# EasyEDA Pro project 1mmFPC_reading_board_source_v1.epro

# Schematic Schematic1
Assembly Variant: Basic; Board Name: Board1; Create Date: 2026-10-10; Page Name: P1; Project Name: rp_reading_board; Schematic Name: Schematic1; Update Date: 2026-10-10; Company: 嘉立创EDA; Page Size: A4; Version: V1.0
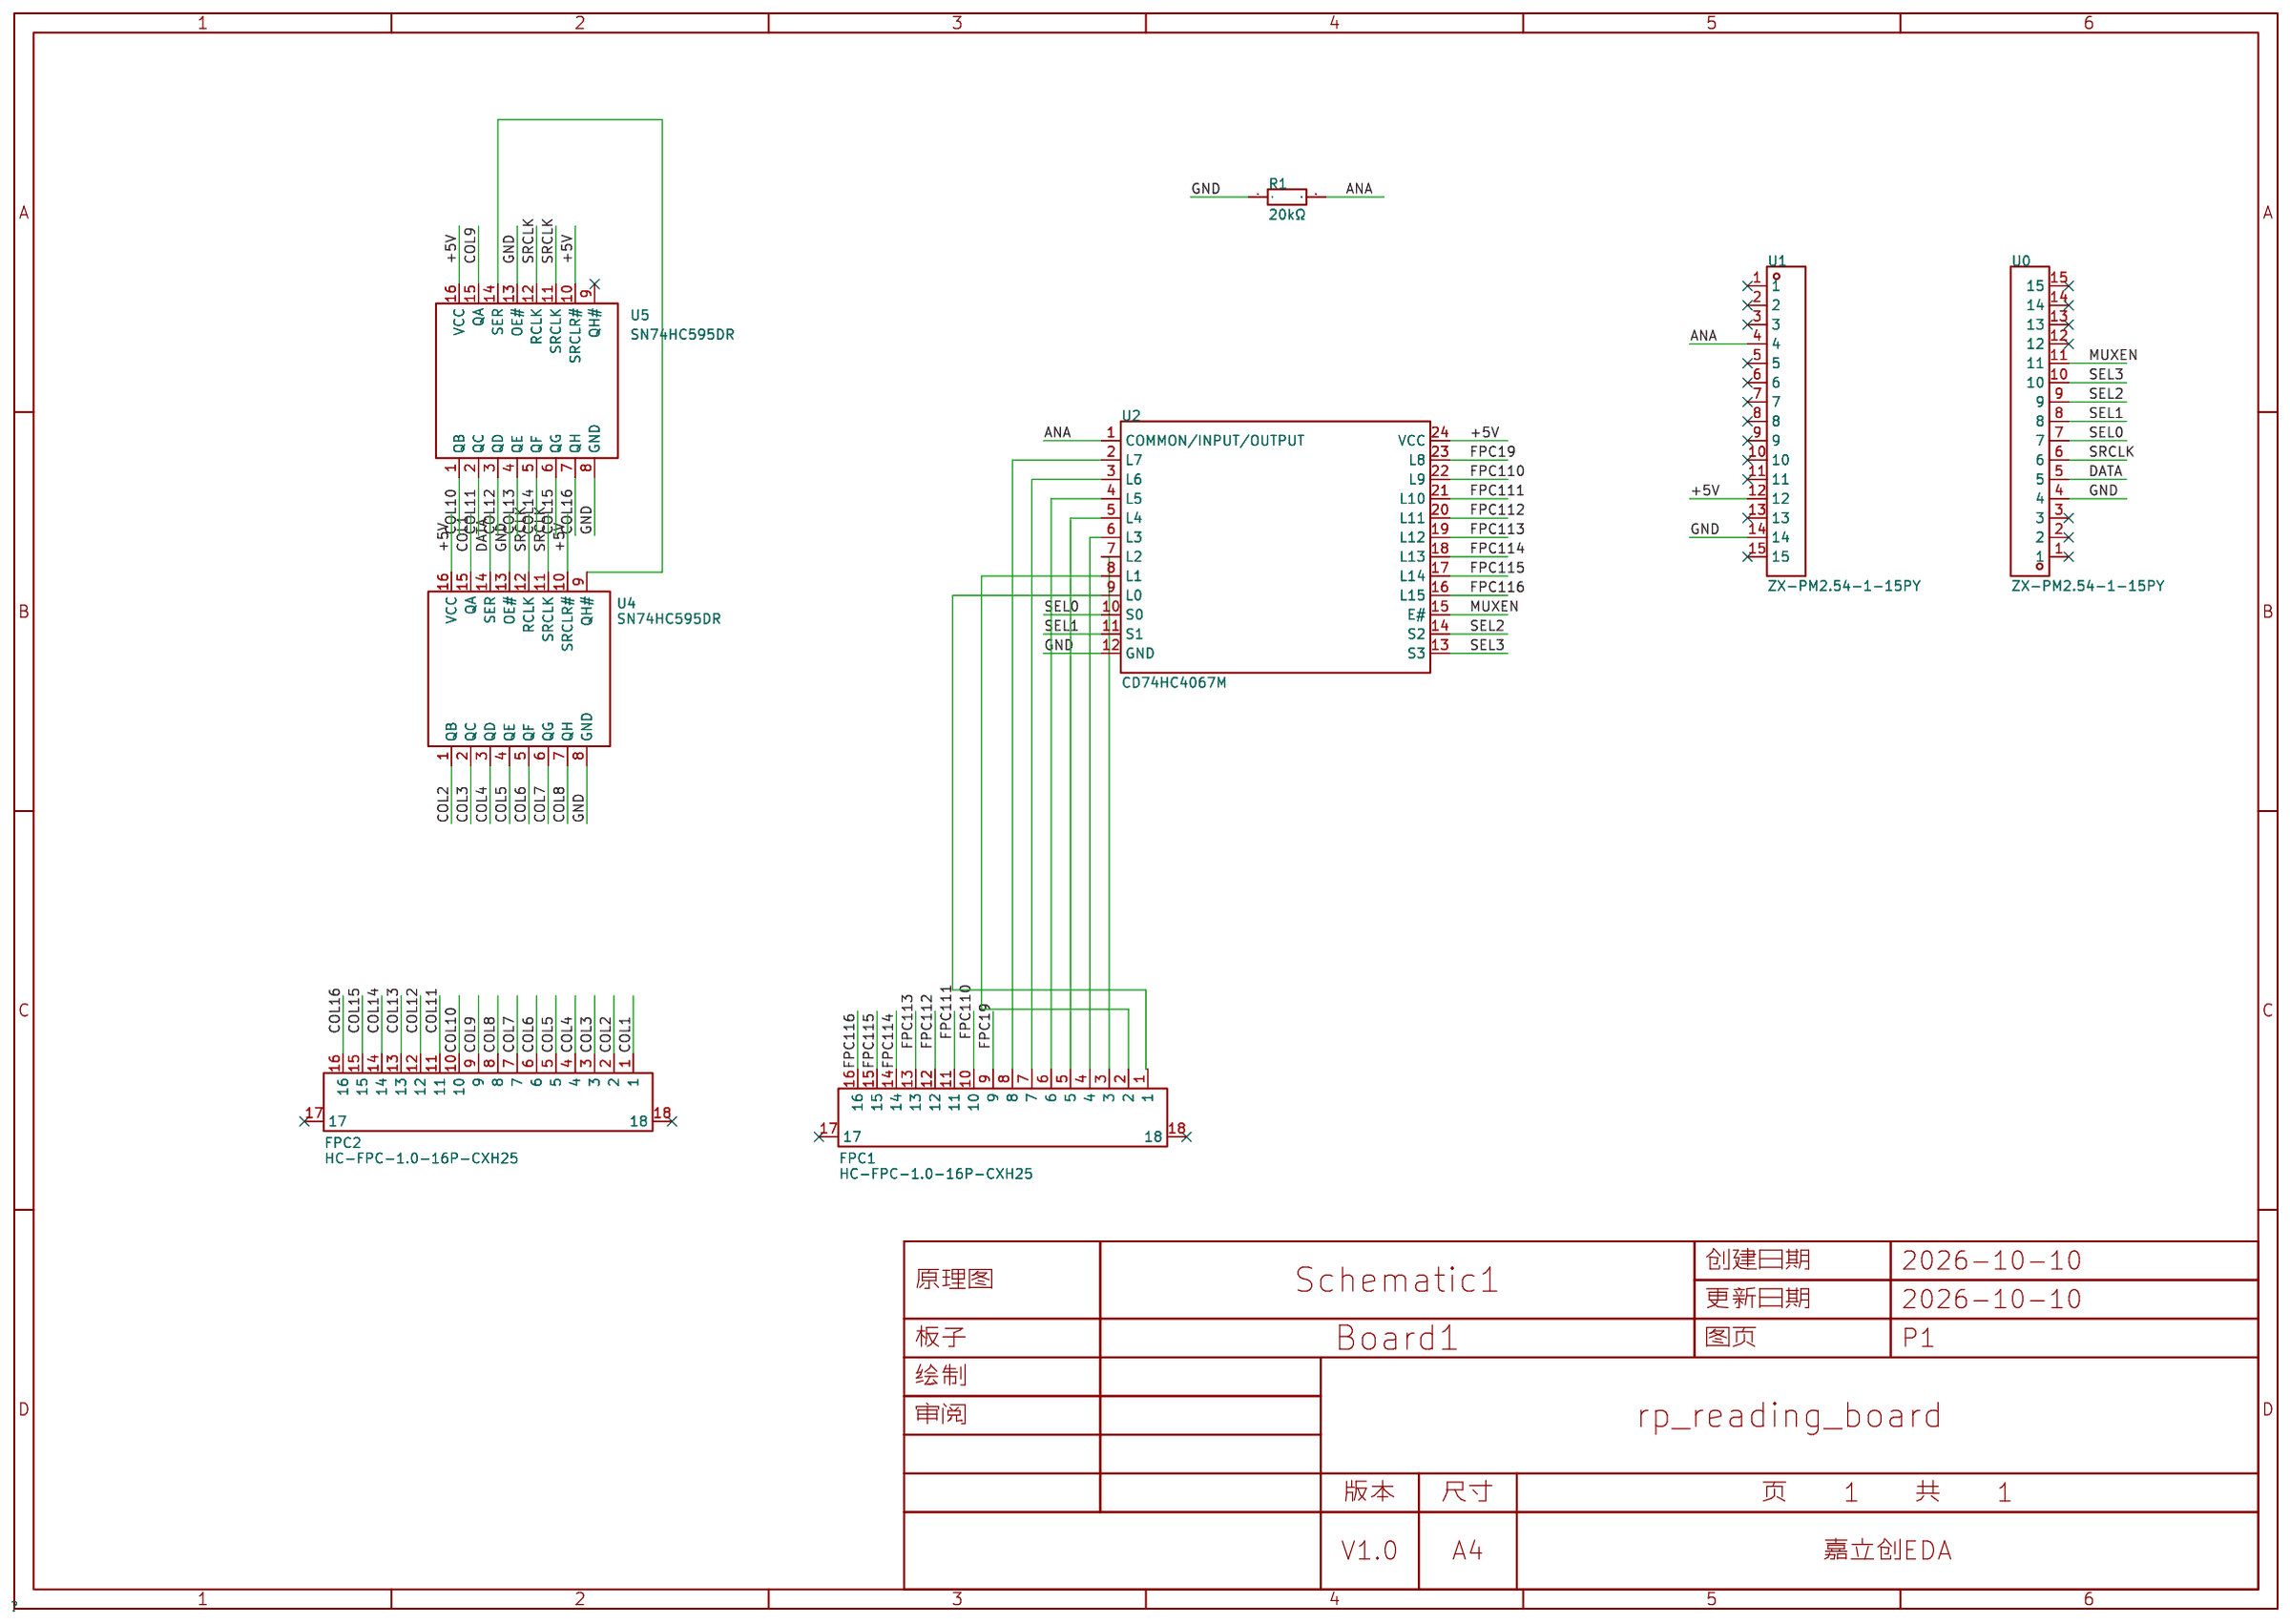
[diagram p0: schematic sheet]

## Parts
FPC1  HC-FPC-1.0-16P-CXH25  [FPC-SMD_16P-P1.00_HC-FPC-1.0-16P-CXH25]
FPC2  HC-FPC-1.0-16P-CXH25  [FPC-SMD_16P-P1.00_HC-FPC-1.0-16P-CXH25]
R1  20kΩ  [R0603]
U0  ZX-PM2.54-1-15PY  [HDR-TH_15P-P2.54-V-F]
U1  ZX-PM2.54-1-15PY  [HDR-TH_15P-P2.54-V-F]
U2  CD74HC4067M  [SOIC-24_L15.4-W7.5-P1.27-LS10.3-BL]
U4  SN74HC595DR  [SOIC-16_L9.9-W3.9-P1.27-LS6.0-BL]
U5  SN74HC595DR  [SOIC-16_L9.9-W3.9-P1.27-LS6.0-BL]

## Library data of the parts
FPC1 FPC2 = HC-FPC-1.0-16P-CXH25: 锁定特性:抽屉式;触点类型:下接;触点数量:16P;间距:1mm;安装方式:卧贴;工作温度:-25℃~+85℃;; LCSC Part Name: 抽屉式 下接 P数:16P 间距:1mm; Supplier Part: C49166851; Manufacturer: HC(虹成电子); Supplier Footprint: SMD,P=1mm,卧贴; JLCPCB Part Class: Extended Part; Datasheet: https://item.szlcsc.com/datasheet/HC-FPC-1.0-16P-CXH25/51557821.html; Supplier: LCSC; Locking Feature: 抽屉式; Contact Type: 下接; Number of Contacts: 16P; Pitch: 1mm; Mounting Type: 卧贴; FFC, FCB Thickness: 0.3mm; Height Above Board: 2.5mm; Operating Temperature: -25℃~+85℃
R1 = 0603WAF2002T5E: 电阻类型:厚膜电阻;阻值:20kΩ;精度:±1%;功率:100mW;工作电压:75V;温度系数:±100ppm/℃;; LCSC Part Name: 厚膜电阻 20kΩ ±1%; Supplier Part: C4184; Manufacturer: UNI-ROYAL(厚声); Supplier Footprint: 0603; JLCPCB Part Class: Basic Part; Datasheet: https://item.szlcsc.com/datasheet/0603WAF2002T5E/4591.html; Supplier: LCSC; Type: 厚膜电阻; Tolerance: ±1%; Power(Watts): 100mW; Voltage-Supply(Max): 75V; Temperature Coefficient: ±100ppm/℃; Operating Temperature: -55℃~+155℃
U0 U1 = ZX-PM2.54-1-15PY: 插孔结构:1x15P;间距:2.54mm;行距:-;圆孔/方孔:方孔;安装方式:直插;排数:单排;总孔位数:15P;额定电流:3A;额定电压:-;插孔方向:顶部;塑高:8.5mm;触头材质:黄铜;触头镀层:金;工作温度:-40℃~+105℃;; LCSC Part Name: 1x15P 间距:2.54mm 直插; Supplier Part: C7499333; Manufacturer: Megastar(兆星); Supplier Footprint: 插件,P=2.54mm; JLCPCB Part Class: Extended Part; Datasheet: https://item.szlcsc.com/datasheet/ZX-PM2.54-1-15PY/8573994.html; Supplier: LCSC; Holes Structure: 1x15P; Pitch: 2.54mm; Circular Hole / Square Hole: 方孔; Mounting Type: 直插; Number of Rows: 单排; Number of Positions: 15P; Current Rating: 3A; Holes Direction: 顶部; Insulation Height: 8.5mm; Contact Material: 黄铜; Contact Plating: 金; Operating Temperature: -40℃~+105℃; PIN Length: 3.2mm
U2 = CD74HC4067M: 开关电路:16:1;通道数:16;导通电阻(Ron):160Ω;; LCSC Part Name: 高速CMOS逻辑 16通道模拟多路复用器/解复用器; Supplier Part: C1545936; Manufacturer: TI(德州仪器); Supplier Footprint: SOIC-24-300mil; JLCPCB Part Class: Extended Part; Datasheet: https://www.ti.com/cn/lit/ds/symlink/cd74hct4067.pdf; Supplier: LCSC; Switch Circuit: 16:1; Number of Channels: 16; Ron: 160Ω; Voltage - Supply: 2V~6V; Turn-on time: 345ns; Turn-off time: 365ns; Bandwidth: 89MHz; Operating Temperature: -55℃~+125℃; Propagation Delay (tpd): 22ns; Features: 双向模拟通道；无毛刺切换
U4 U5 = SN74HC595DR: 功能:串行至串行或并行;工作电压:2V~6V;时钟频率(fc):29MHz;元件数:1;; LCSC Part Name: 三态输出 8位串行至串行或并行移位寄存器; Supplier Part: C10092; Manufacturer: TI(德州仪器); Supplier Footprint: SOIC-16; JLCPCB Part Class: Extended Part; Datasheet: https://www.ti.com/cn/lit/ds/symlink/sn74hc595.pdf; Supplier: LCSC; Function: 串行至串行或并行; Voltage - Supply: 2V~6V; Clock Frequency: 29MHz; Number of Elements: 1; Output Type: 三态; Series: 74HC; Propagation Delay: 26ns@6V,50pF; Output Current: 6mA; Resolution: 8; Current - Output Low(IOL): 6mA; Current - Output High(IOH): 6mA; Operating Temperature: -40℃~+85℃; Features: 异步清零功能；输出使能

## Nets
+5V: U1.12 U2.24(VCC) U4.10(SRCLR#) U4.16(VCC) U5.10(SRCLR#) U5.16(VCC)
GND: R1.1 U0.4 U1.14 U2.12(GND) U4.8(GND) U4.13(OE#) U5.8(GND) U5.13(OE#)
ANA: R1.2 U1.4 U2.1(COMMON/INPUT/OUTPUT)
COL1: FPC2.1 U4.15(QA)
COL2: FPC2.2 U4.1(QB)
COL3: FPC2.3 U4.2(QC)
COL4: FPC2.4 U4.3(QD)
COL5: FPC2.5 U4.4(QE)
COL6: FPC2.6 U4.5(QF)
COL7: FPC2.7 U4.6(QG)
COL8: FPC2.8 U4.7(QH)
COL9: FPC2.9 U5.15(QA)
COL10: FPC2.10 U5.1(QB)
COL11: FPC2.11 U5.2(QC)
COL12: FPC2.12 U5.3(QD)
COL13: FPC2.13 U5.4(QE)
COL14: FPC2.14 U5.5(QF)
COL15: FPC2.15 U5.6(QG)
COL16: FPC2.16 U5.7(QH)
DATA: U0.5 U4.14(SER)
FPC19: FPC1.9 U2.23(L8)
FPC110: FPC1.10 U2.22(L9)
FPC111: FPC1.11 U2.21(L10)
FPC112: FPC1.12 U2.20(L11)
FPC113: FPC1.13 U2.19(L12)
FPC114: FPC1.14 U2.18(L13)
FPC115: FPC1.15 U2.17(L14)
FPC116: FPC1.16 U2.16(L15)
MUXEN: U0.11 U2.15(E#)
SEL0: U0.7 U2.10(S0)
SEL1: U0.8 U2.11(S1)
SEL2: U0.9 U2.14(S2)
SEL3: U0.10 U2.13(S3)
SRCLK: U0.6 U4.11(SRCLK) U4.12(RCLK) U5.11(SRCLK) U5.12(RCLK)
$1N42: FPC1.8 U2.2(L7)
$1N43: FPC1.7 U2.3(L6)
$1N44: FPC1.6 U2.4(L5)
$1N45: FPC1.5 U2.5(L4)
$1N46: FPC1.4 U2.6(L3)
$1N48: FPC1.3 U2.7(L2)
$1N49: FPC1.2 U2.8(L1)
$1N50: FPC1.1 U2.9(L0)
$1N67: U4.9(QH#) U5.14(SER)

Not connected (* = marked no-connect by the designer): FPC1 17* 18*; FPC2 17* 18*; U0 1* 2* 3* 12* 13* 14* 15*; U1 1* 2* 3* 5* 6* 7* 8* 9* 10* 11* 13* 15*; U5 9(QH#)*

# Board PCB1
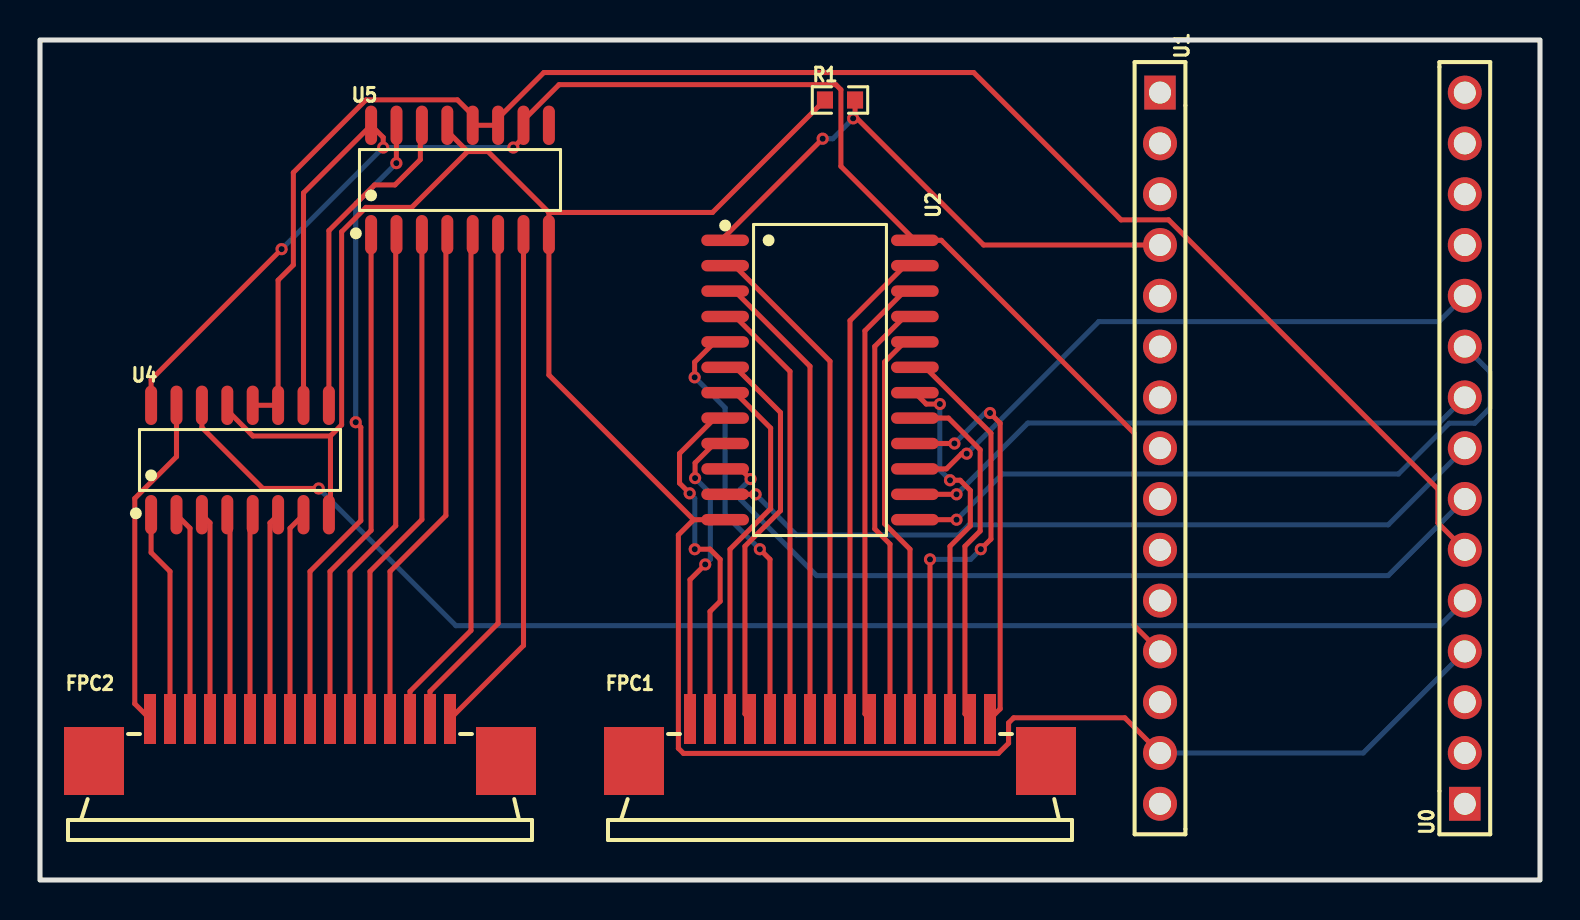
[diagram p1: board, top side]
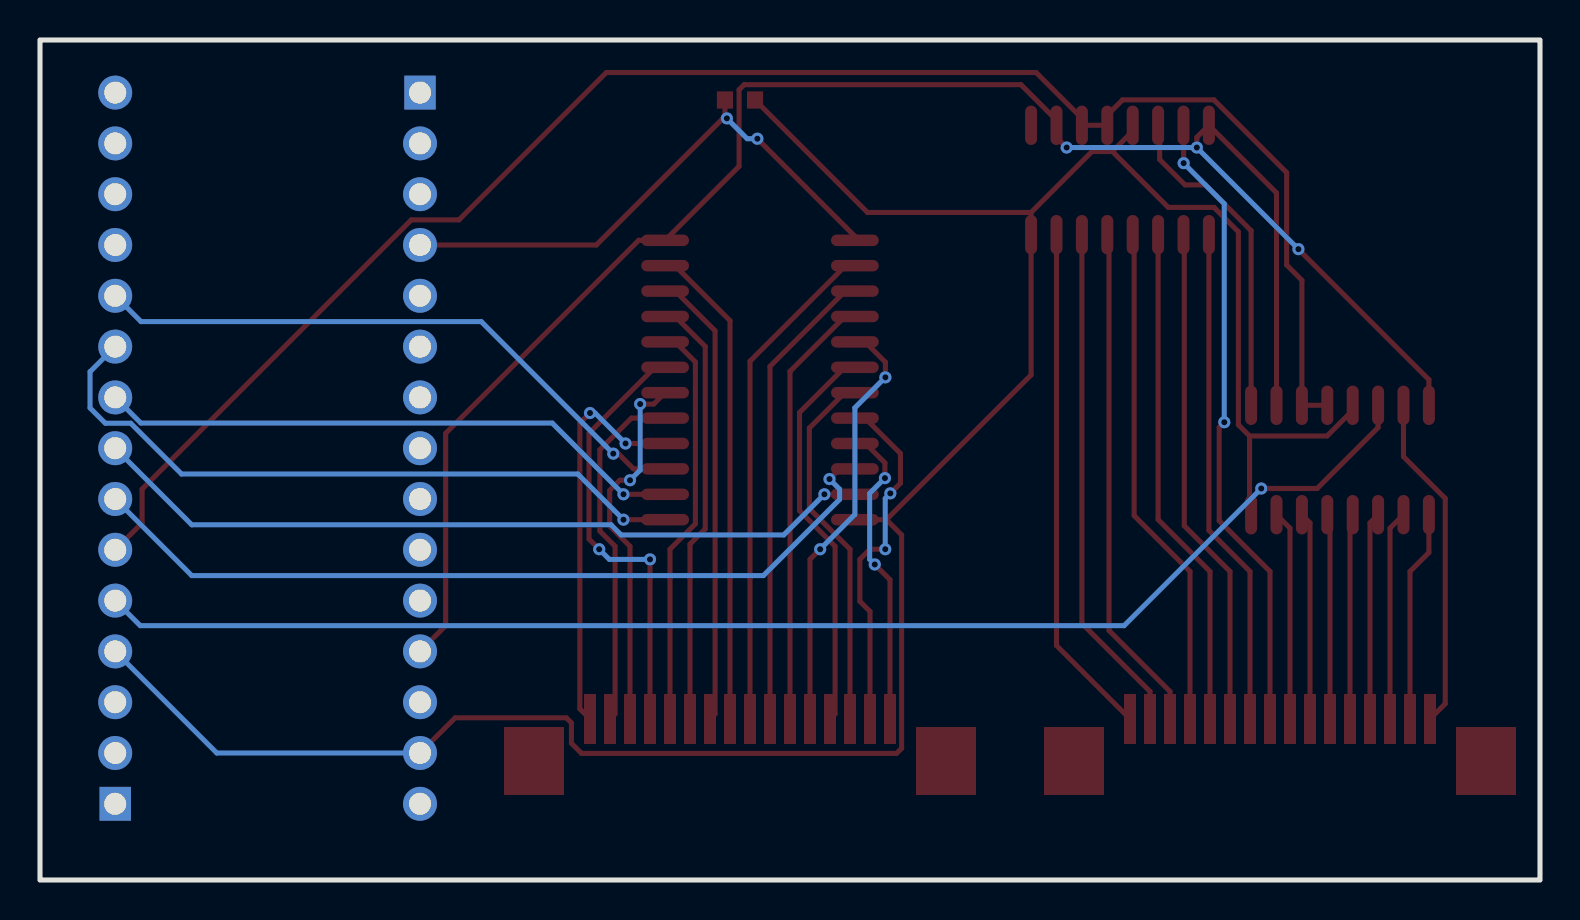
[diagram p2: board, bottom side, seen from below]

Outline 75 x 42 mm; copper layers: Top Layer, Bottom Layer. Coordinates in mm from the lower left corner of the outline.
Outline path: rectangle 0,42 75,0
Stack: Top Layer 0.035mm / Dielectric1 1.51mm FR4 er 4.5 / Bottom Layer 0.035mm

## Design rules (mm)
spacing copperThickness1oz (default): track to track 0.102, other pairs 0.152 to 0.3
spacing copperThickness2oz: track to track 0.203, other pairs 0.152 to 0.3
track width copperThickness1oz (default): min 0.127, default 0.254, max 2.54
track width copperThickness2oz: min 0.203, default 0.254, max 2.54
differential pair differentialPair (default): width min 0.127, default 0.254, max 2.54; gap min 0.152, default 0.152

## Placement (name value [footprint] x y rotation side)
FPC1  HC-FPC-1.0-16P-CXH25  [FPC-SMD_16P-P1.00_HC-FPC-1.0-16P-CXH25]  40 7 0 top
FPC2  HC-FPC-1.0-16P-CXH25  [FPC-SMD_16P-P1.00_HC-FPC-1.0-16P-CXH25]  13 7 0 top
R1  20kΩ  [R0603]  40 39 0 top
U0  ZX-PM2.54-1-15PY  [HDR-TH_15P-P2.54-V-F]  71.24 21.59 90 top
U1  ZX-PM2.54-1-15PY  [HDR-TH_15P-P2.54-V-F]  56 21.59 270 top
U2  CD74HC4067M  [SOIC-24_L15.4-W7.5-P1.27-LS10.3-BL]  39 25 270 top
U4  SN74HC595DR  [SOIC-16_L9.9-W3.9-P1.27-LS6.0-BL]  10 21 0 top
U5  SN74HC595DR  [SOIC-16_L9.9-W3.9-P1.27-LS6.0-BL]  21 35 0 top

## Footprints (pads in the part's own frame, mm; a bottom-side part is the same pattern mirrored in y, then rotated)
FPC-SMD_16P-P1.00_HC-FPC-1.0-16P-CXH25
  rect 0.6x2.5 smd: 1(-7.5,1.05) 2(-6.5,1.05) 3(-5.5,1.05) 4(-4.5,1.05) 5(-3.5,1.05) 6(-2.5,1.05) 7(-1.5,1.05) 8(-0.5,1.05) 9(0.5,1.05) 10(1.5,1.05) 11(2.5,1.05) 12(3.5,1.05) 13(4.5,1.05) 14(5.5,1.05) 15(6.5,1.05) 16(7.5,1.05)
  rect 3x3.4 smd: 17(10.3,-1.05) 18(-10.3,-1.05)
HDR-TH_15P-P2.54-V-F
  rect 1.7x1.575 hole 1.1: 1(-17.78,0)
  round 1.7 hole 1.1: 2(-15.24,0) 3(-12.7,0) 4(-10.16,0) 5(-7.62,0) 6(-5.08,0) 7(-2.54,0) 8(0,0) 9(2.54,0) 10(5.08,0) 11(7.62,0) 12(10.16,0) 13(12.7,0) 14(15.24,0) 15(17.78,0)
R0603
  rect 0.806x0.864 smd: 1(-0.753,0) 2(0.753,0)
SOIC-16_L9.9-W3.9-P1.27-LS6.0-BL
  oval 0.602x1.971 smd: 1(-4.445,-2.736) 2(-3.175,-2.736) 3(-1.905,-2.736) 4(-0.635,-2.736) 5(0.635,-2.736) 6(1.905,-2.736) 7(3.175,-2.736) 8(4.445,-2.736) 9(4.445,2.736) 10(3.175,2.736) 11(1.905,2.736) 12(0.635,2.736) 13(-0.635,2.736) 14(-1.905,2.736) 15(-3.175,2.736) 16(-4.445,2.736)
SOIC-24_L15.4-W7.5-P1.27-LS10.3-BL
  oval 0.574x2.388 smd: 1(-6.985,-4.744) 2(-5.715,-4.744) 3(-4.445,-4.744) 4(-3.175,-4.744) 5(-1.905,-4.744) 6(-0.635,-4.744) 7(0.635,-4.744) 8(1.905,-4.744) 9(3.175,-4.744) 10(4.445,-4.744) 11(5.715,-4.744) 12(6.985,-4.744) 13(6.985,4.744) 14(5.715,4.744) 15(4.445,4.744) 16(3.175,4.744) 17(1.905,4.744) 18(0.635,4.744) 19(-0.635,4.744) 20(-1.905,4.744) 21(-3.175,4.744) 22(-4.445,4.744) 23(-5.715,4.744) 24(-6.985,4.744)

## Nets
As in the schematic.

Pads without a net: FPC1 17 18; FPC2 17 18; U0 1 2 3 12 13 14 15; U1 1 2 3 5 6 7 8 9 10 11 13 15; U5 9

## Via types
v1: diameter 0.61, hole 0.305, Top Layer to Bottom Layer, 25 vias

## Routing (per net, layer and track width the routed paths; a pad name or vN(x,y) marks a point on that pad's centre or on a via; arc(x,y) is an arc through that point)
+5V: length 94.7
  Top Layer w0.254: v1(23.67,36.62) 24.18,37.13 U5.10 24.18,37.99 25.95,39.77 39.79,39.77 40.05,39.51 40.05,35.68 U2.24 45.06,31.98 54.72,22.33 54.72,12.71 U1.12 ; U4.10 13.17,34.36 U5.16 17.16,37.13 v1(17.16,36.62) ; v1(12.08,31.54) 5.56,25.02 U4.16
  Bottom Layer w0.254: v1(12.08,31.54) v1(17.16,36.62) v1(23.67,36.62)
GND: length 126.8
  Top Layer w0.254: 32.68,18.02 31.92,17.25 31.92,6.58 32.17,6.33 47.92,6.33 48.43,6.84 48.43,7.86 48.68,8.11 54.24,8.11 U1.14 ; 32.68,18.02 U2.12 ; 32.68,18.02 25.44,25.25 U5.8 25.44,33.38 ; U4.8 14.52,18.34 14.52,22.2 ; 25.44,33.38 33.62,33.38 R1.1 ; 25.44,33.38 22.4,36.42 21.38,36.42 ; 21.38,36.42 18.59,33.63 16.3,33.63 15.08,32.41 15.08,22.76 14.52,22.2 ; 21.38,36.42 20.37,37.44 U5.13 ; U4.13 9.36,23.48 10.65,22.2 14.52,22.2
  Bottom Layer w0.254: U0.4 66.16,6.35 U1.14
ANA: length 27.9
  Top Layer w0.254: 40.75,38.18 47.18,31.75 U1.4 ; 40.75,38.18 v1(40.66,38.08) ; 40.75,38.18 R1.2 ; v1(39.13,37.06) 34.26,32.19 U2.1
  Bottom Layer w0.254: v1(39.13,37.06) 39.64,37.06 v1(40.66,38.08)
COL1: length 16.9
  Top Layer w0.254: U4.15 6.83,21.17 4.74,19.08 4.74,8.81 FPC2.1
COL2: length 10.6
  Top Layer w0.254: FPC2.2 6.5,15.43 5.56,16.37 U4.1
COL3: length 10.5
  Top Layer w0.254: U4.2 7.5,17.59 FPC2.3
COL4: length 10.4
  Top Layer w0.254: FPC2.4 8.5,17.86 U4.3
COL5: length 10.3
  Top Layer w0.254: U4.4 9.5,18.13 FPC2.5
COL6: length 10.3
  Top Layer w0.254: FPC2.6 10.5,18.13 U4.5
COL7: length 10.4
  Top Layer w0.254: FPC2.7 11.5,17.86 U4.6
COL8: length 10.5
  Top Layer w0.254: U4.7 12.5,17.59 FPC2.8
COL9: length 31.7
  Top Layer w0.254: v1(17.82,35.84) 17.82,37.73 U5.15 ; FPC2.9 13.5,15.43 16.04,17.97 16.04,22.64 v1(15.79,22.89)
  Bottom Layer w0.254: v1(17.82,35.84) 15.79,33.81 v1(15.79,22.89)
COL10: length 25.1
  Top Layer w0.254: FPC2.10 14.5,15.43 16.56,17.48 U5.1
COL11: length 25.2
  Top Layer w0.254: FPC2.11 15.5,15.43 17.79,17.71 17.79,32.23 U5.2
COL12: length 25.3
  Top Layer w0.254: U5.3 19.09,18.02 16.5,15.43 FPC2.12
COL13: length 25.4
  Top Layer w0.254: U5.4 20.29,32.19 20.29,18.22 17.5,15.43 FPC2.13
COL14: length 25.5
  Top Layer w0.254: U5.5 21.55,32.18 21.55,12.47 18.5,9.43 FPC2.14
COL15: length 25.6
  Top Layer w0.254: FPC2.15 19.5,9.43 22.91,12.83 U5.6
COL16: length 25.7
  Top Layer w0.254: FPC2.16 24.18,11.72 U5.7
DATA: length 68.9
  Top Layer w0.254: U4.14 8.09,22.62 11.14,19.58 v1(13.94,19.58)
  Bottom Layer w0.254: v1(13.94,19.58) 20.79,12.72 69.99,12.72 U0.5
FPC19: length 24.3
  Top Layer w0.254: U2.23 43.25,30.72 40.5,27.97 FPC1.9
FPC110: length 22.8
  Top Layer w0.254: FPC1.10 41.25,8.3 41.25,27.46 43.23,29.44 U2.22
FPC111: length 21.6
  Top Layer w0.254: U2.21 43.24,28.17 41.74,26.68 41.74,17.56 42.5,16.79 FPC1.11
FPC112: length 20.3
  Top Layer w0.254: U2.20 43.73,26.92 43.25,26.92 42.23,25.9 42.23,17.81 43.5,16.54 FPC1.12
FPC113: length 21.9
  Top Layer w0.254: FPC1.13 v1(44.5,16.03) ; v1(47.04,16.54) 47.55,17.05 47.55,22.34 44.25,25.64 U2.19
  Bottom Layer w0.254: v1(47.04,16.54) 46.53,16.03 v1(44.5,16.03)
FPC114: length 18.6
  Top Layer w0.254: v1(44.99,23.8) 44.31,23.8 U2.18 ; FPC1.14 45.5,16.69 46.52,17.7 46.52,19.48 46.01,19.99 v1(45.5,19.99)
  Bottom Layer w0.254: v1(45.5,19.99) 44.99,20.5 v1(44.99,23.8)
FPC115: length 17.8
  Top Layer w0.254: U2.17 45.43,23.09 47.01,21.51 47.01,17.45 46.25,16.69 46.25,8.3 FPC1.15
FPC116: length 20.1
  Top Layer w0.254: FPC1.16 48.01,8.56 48.01,22.84 v1(47.5,23.35) ; v1(45.72,21.83) U2.16
  Bottom Layer w0.254: v1(45.72,21.83) 47.25,23.35 v1(47.5,23.35)
MUXEN: length 31.1
  Top Layer w0.254: v1(46.34,21.32) 46.08,21.32 45.32,20.56 U2.15
  Bottom Layer w0.254: v1(46.34,21.32) 52.94,27.92 69.95,27.92 U0.11
SEL0: length 42.1
  Top Layer w0.254: v1(35.53,20.05) 35.02,20.56 U2.10
  Bottom Layer w0.254: v1(35.53,20.05) 35.02,19.54 35.02,19.03 38.83,15.22 67.41,15.22 U0.7
SEL1: length 39.6
  Top Layer w0.254: U2.11 v1(35.78,19.28)
  Bottom Layer w0.254: v1(35.78,19.28) 37.81,17.25 45.94,17.25 46.45,17.76 67.41,17.76 U0.8
SEL2: length 29.5
  Top Layer w0.254: U2.14 v1(45.83,19.28)
  Bottom Layer w0.254: v1(45.83,19.28) 49.39,22.85 69.96,22.85 U0.9
SEL3: length 34.7
  Top Layer w0.254: U2.13 v1(45.83,18.02)
  Bottom Layer w0.254: v1(45.83,18.02) 48.11,20.3 67.93,20.3 70.47,22.84 71.74,22.84 72.5,23.6 72.5,25.41 U0.10
SRCLK: length 86.3
  Top Layer w0.254: U4.12 U4.11 11.91,29.99 12.67,30.75 12.67,35.37 16.3,39.01 20.87,39.01 21.63,38.24 U5.12 U5.11 22.91,38.09 25.19,40.37 46.69,40.37 54.05,33.01 56.43,33.01 69.9,19.54 69.9,17.86 U0.6
$1N42: length 25.1
  Top Layer w0.254: FPC1.8 39.5,25.94 34.72,30.72 U2.2
$1N43: length 23.4
  Top Layer w0.254: U2.3 34.74,29.44 38.5,25.68 FPC1.7
$1N44: length 21.8
  Top Layer w0.254: FPC1.6 37.5,25.43 34.75,28.17 U2.4
$1N45: length 21.3
  Top Layer w0.254: v1(32.73,25.13) 32.73,25.89 33.75,26.91 34.25,26.91 ; v1(35.99,16.54) 36.5,16.03 FPC1.5
  Bottom Layer w0.254: v1(35.99,16.54) 34.26,18.28 34.26,23.61 v1(32.73,25.13)
$1N46: length 19.9
  Top Layer w0.254: FPC1.4 35.25,8.3 35.25,16.69 37.02,18.46 37.02,23.38 34.76,25.64 U2.6
$1N48: length 18.4
  Top Layer w0.254: FPC1.3 34.5,16.54 36.53,18.57 36.53,22.6 34.75,24.38 34.27,24.38 U2.7
$1N49: length 17.8
  Top Layer w0.254: FPC1.2 33.5,13.43 34.01,13.94 34.01,16.03 33.5,16.54 v1(32.74,16.54) ; U2.8 33.75,23.09 31.98,21.32 31.98,19.84 v1(32.48,19.33)
  Bottom Layer w0.254: v1(32.48,19.33) 32.74,19.08 v1(32.74,16.54)
$1N50: length 15.4
  Top Layer w0.254: v1(33.26,15.78) 32.5,15.02 FPC1.1 ; U2.9 33.72,21.83 32.75,20.86 v1(32.75,20.09)
  Bottom Layer w0.254: v1(32.75,20.09) 33.52,19.33 33.52,16.03 v1(33.26,15.78)
$1N67: length 16.5
  Top Layer w0.254: U5.14 19.02,37.66 19.02,36.02 17.75,34.75 16.73,34.75 14.44,32.47 U4.9
